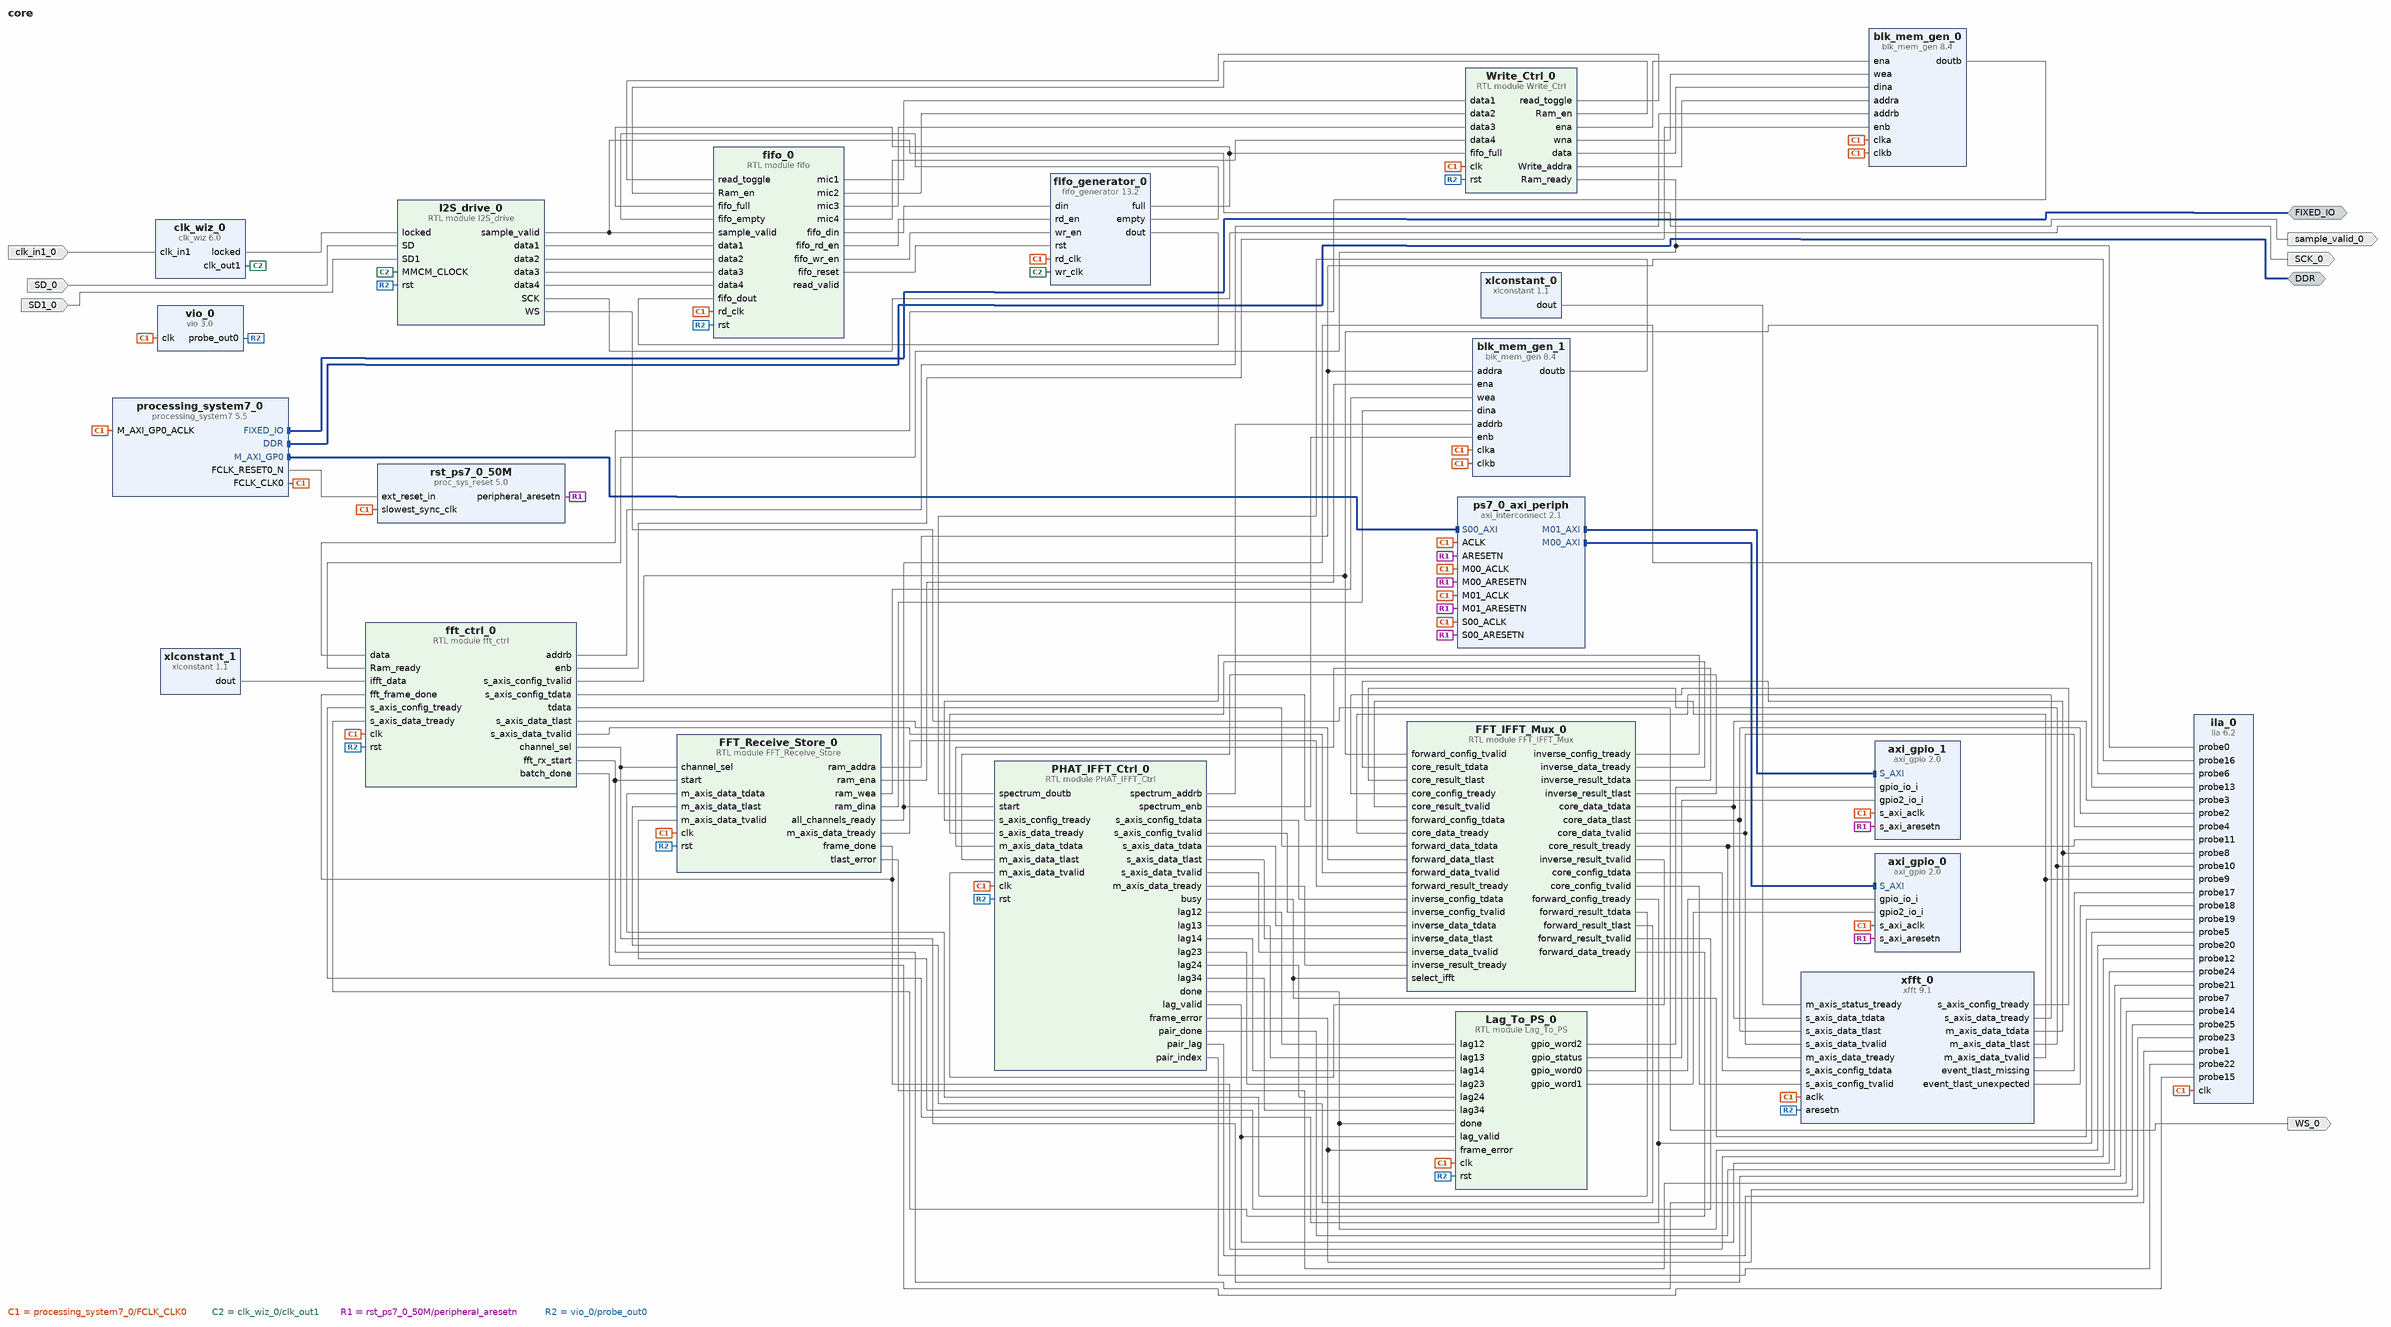
[diagram p0: block diagram of the top level]
# Vivado block design core, xc7z020clg400-1, Vivado 2018.3
create_bd_design core

create_bd_intf_port -mode Master -vlnv xilinx.com:interface:ddrx_rtl:1.0 DDR
create_bd_intf_port -mode Master -vlnv xilinx.com:display_processing_system7:fixedio_rtl:1.0 FIXED_IO
create_bd_port -dir I -type clk clk_in1_0
create_bd_port -dir I SD_0
create_bd_port -dir O SCK_0
create_bd_port -dir O WS_0
create_bd_port -dir O sample_valid_0
create_bd_port -dir I SD1_0

create_bd_cell -type ip -vlnv xilinx.com:ip:processing_system7:5.5 processing_system7_0
set_property -dict [list \
  CONFIG.PCW_GPIO_MIO_GPIO_ENABLE 0 \
  CONFIG.PCW_PRESET_BANK1_VOLTAGE {LVCMOS 1.8V} \
  CONFIG.PCW_QSPI_PERIPHERAL_ENABLE 0 \
  CONFIG.PCW_UART0_PERIPHERAL_ENABLE 1 \
  CONFIG.PCW_UART0_UART0_IO {MIO 14 .. 15} \
  CONFIG.PCW_UART_PERIPHERAL_FREQMHZ 100 \
  CONFIG.PCW_UIPARAM_DDR_FREQ_MHZ 533.333333 \
  CONFIG.PCW_UIPARAM_DDR_PARTNO {MT41K256M16 RE-125} \
] [get_bd_cells processing_system7_0]
# 71 more settings of processing_system7_0 are not shown: defaults, MIO pin electricals, DDR timing, and values the tool derives
create_bd_cell -type ip -vlnv xilinx.com:ip:clk_wiz:6.0 clk_wiz_0
set_property -dict [list \
  CONFIG.CLKOUT1_JITTER 299.507 \
  CONFIG.CLKOUT1_PHASE_ERROR 189.550 \
  CONFIG.CLKOUT1_REQUESTED_OUT_FREQ 11.2896 \
  CONFIG.MMCM_CLKFBOUT_MULT_F 31.625 \
  CONFIG.MMCM_CLKOUT0_DIVIDE_F 93.375 \
  CONFIG.MMCM_DIVCLK_DIVIDE 3 \
] [get_bd_cells clk_wiz_0]
create_bd_cell -type ip -vlnv xilinx.com:ip:axi_gpio:2.0 axi_gpio_0
set_property -dict [list \
  CONFIG.C_ALL_INPUTS 1 \
  CONFIG.C_ALL_INPUTS_2 1 \
  CONFIG.C_GPIO2_WIDTH 32 \
  CONFIG.C_GPIO_WIDTH 32 \
  CONFIG.C_IS_DUAL 1 \
] [get_bd_cells axi_gpio_0]
create_bd_cell -type ip -vlnv xilinx.com:ip:axi_interconnect:2.1 ps7_0_axi_periph
set_property -dict {CONFIG.NUM_MI 2} [get_bd_cells ps7_0_axi_periph]
create_bd_cell -type ip -vlnv xilinx.com:ip:proc_sys_reset:5.0 rst_ps7_0_50M
create_bd_cell -type ip -vlnv xilinx.com:ip:fifo_generator:13.2 fifo_generator_0
set_property -dict [list \
  CONFIG.Enable_Safety_Circuit true \
  CONFIG.Fifo_Implementation Independent_Clocks_Block_RAM \
  CONFIG.Full_Flags_Reset_Value 1 \
  CONFIG.Input_Data_Width 96 \
  CONFIG.Input_Depth 2048 \
  CONFIG.Output_Data_Width 96 \
  CONFIG.Performance_Options First_Word_Fall_Through \
  CONFIG.Use_Extra_Logic false \
] [get_bd_cells fifo_generator_0]
create_bd_cell -type ip -vlnv xilinx.com:ip:axi_gpio:2.0 axi_gpio_1
set_property -dict [list \
  CONFIG.C_ALL_INPUTS 1 \
  CONFIG.C_ALL_INPUTS_2 1 \
  CONFIG.C_GPIO2_WIDTH 32 \
  CONFIG.C_GPIO_WIDTH 32 \
  CONFIG.C_IS_DUAL 1 \
] [get_bd_cells axi_gpio_1]
create_bd_cell -type ip -vlnv xilinx.com:ip:xfft:9.1 xfft_0
set_property -dict [list \
  CONFIG.aresetn true \
  CONFIG.data_format fixed_point \
  CONFIG.implementation_options radix_4_burst_io \
  CONFIG.input_width 24 \
  CONFIG.number_of_stages_using_block_ram_for_data_and_phase_factors 0 \
  CONFIG.output_ordering natural_order \
  CONFIG.phase_factor_width 24 \
  CONFIG.rounding_modes convergent_rounding \
  CONFIG.scaling_options block_floating_point \
  CONFIG.target_clock_frequency 50 \
  CONFIG.transform_length 4096 \
] [get_bd_cells xfft_0]
create_bd_cell -type ip -vlnv xilinx.com:ip:blk_mem_gen:8.4 blk_mem_gen_0
set_property -dict [list \
  CONFIG.Enable_32bit_Address false \
  CONFIG.Enable_B Use_ENB_Pin \
  CONFIG.Memory_Type Simple_Dual_Port_RAM \
  CONFIG.Operating_Mode_A NO_CHANGE \
  CONFIG.Port_A_Write_Rate 50 \
  CONFIG.Port_B_Clock 100 \
  CONFIG.Port_B_Enable_Rate 100 \
  CONFIG.Read_Width_B 24 \
  CONFIG.Register_PortB_Output_of_Memory_Primitives true \
  CONFIG.Use_Byte_Write_Enable false \
  CONFIG.Use_RSTB_Pin false \
  CONFIG.Write_Depth_A 2048 \
  CONFIG.Write_Width_A 96 \
  CONFIG.Write_Width_B 24 \
  CONFIG.use_bram_block Stand_Alone \
] [get_bd_cells blk_mem_gen_0]
create_bd_cell -type module -reference fifo fifo_0
create_bd_cell -type module -reference FFT_Receive_Store FFT_Receive_Store_0
create_bd_cell -type ip -vlnv xilinx.com:ip:blk_mem_gen:8.4 blk_mem_gen_1
set_property -dict [list \
  CONFIG.Enable_32bit_Address false \
  CONFIG.Enable_B Use_ENB_Pin \
  CONFIG.Memory_Type Simple_Dual_Port_RAM \
  CONFIG.Operating_Mode_A NO_CHANGE \
  CONFIG.Port_B_Clock 100 \
  CONFIG.Port_B_Enable_Rate 100 \
  CONFIG.Read_Width_B 48 \
  CONFIG.Register_PortB_Output_of_Memory_Primitives true \
  CONFIG.Use_Byte_Write_Enable false \
  CONFIG.Write_Depth_A 16384 \
  CONFIG.Write_Width_A 48 \
  CONFIG.Write_Width_B 48 \
  CONFIG.use_bram_block Stand_Alone \
] [get_bd_cells blk_mem_gen_1]
create_bd_cell -type module -reference fft_ctrl fft_ctrl_0
create_bd_cell -type ip -vlnv xilinx.com:ip:xlconstant:1.1 xlconstant_0
create_bd_cell -type ip -vlnv xilinx.com:ip:xlconstant:1.1 xlconstant_1
set_property -dict {CONFIG.CONST_VAL 0 CONFIG.CONST_WIDTH 48} [get_bd_cells xlconstant_1]
create_bd_cell -type ip -vlnv xilinx.com:ip:ila:6.2 ila_0
set_property -dict [list \
  CONFIG.C_DATA_DEPTH 4096 \
  CONFIG.C_ENABLE_ILA_AXI_MON false \
  CONFIG.C_MONITOR_TYPE Native \
  CONFIG.C_NUM_OF_PROBES 26 \
  CONFIG.C_PROBE16_WIDTH 14 \
  CONFIG.C_PROBE22_WIDTH 3 \
  CONFIG.C_PROBE23_WIDTH 16 \
  CONFIG.C_PROBE24_WIDTH 6 \
  CONFIG.C_PROBE3_WIDTH 48 \
  CONFIG.C_PROBE7_WIDTH 2 \
  CONFIG.C_PROBE8_WIDTH 48 \
] [get_bd_cells ila_0]
create_bd_cell -type ip -vlnv xilinx.com:ip:vio:3.0 vio_0
set_property -dict {CONFIG.C_NUM_PROBE_IN 0} [get_bd_cells vio_0]
create_bd_cell -type module -reference PHAT_IFFT_Ctrl PHAT_IFFT_Ctrl_0
create_bd_cell -type module -reference FFT_IFFT_Mux FFT_IFFT_Mux_0
create_bd_cell -type module -reference I2S_drive I2S_drive_0
create_bd_cell -type module -reference Write_Ctrl Write_Ctrl_0
create_bd_cell -type module -reference Lag_To_PS Lag_To_PS_0

# ---- connections ----

connect_bd_intf_net [get_bd_intf_pins processing_system7_0/M_AXI_GP0] [get_bd_intf_pins ps7_0_axi_periph/S00_AXI]
connect_bd_intf_net [get_bd_intf_ports FIXED_IO] [get_bd_intf_pins processing_system7_0/FIXED_IO]
connect_bd_intf_net [get_bd_intf_pins ps7_0_axi_periph/M00_AXI] [get_bd_intf_pins axi_gpio_0/S_AXI]
connect_bd_intf_net [get_bd_intf_ports DDR] [get_bd_intf_pins processing_system7_0/DDR]
connect_bd_intf_net [get_bd_intf_pins ps7_0_axi_periph/M01_AXI] [get_bd_intf_pins axi_gpio_1/S_AXI]
connect_bd_net [get_bd_pins processing_system7_0/FCLK_CLK0] \
  [get_bd_pins processing_system7_0/M_AXI_GP0_ACLK] [get_bd_pins ps7_0_axi_periph/S00_ACLK] \
  [get_bd_pins rst_ps7_0_50M/slowest_sync_clk] [get_bd_pins axi_gpio_0/s_axi_aclk] [get_bd_pins ps7_0_axi_periph/M00_ACLK] \
  [get_bd_pins ps7_0_axi_periph/ACLK] [get_bd_pins fifo_generator_0/rd_clk] [get_bd_pins axi_gpio_1/s_axi_aclk] \
  [get_bd_pins ps7_0_axi_periph/M01_ACLK] [get_bd_pins fifo_0/rd_clk] [get_bd_pins FFT_Receive_Store_0/clk] \
  [get_bd_pins blk_mem_gen_1/clka] [get_bd_pins blk_mem_gen_0/clkb] [get_bd_pins fft_ctrl_0/clk] [get_bd_pins xfft_0/aclk] \
  [get_bd_pins blk_mem_gen_0/clka] [get_bd_pins ila_0/clk] [get_bd_pins vio_0/clk] [get_bd_pins PHAT_IFFT_Ctrl_0/clk] \
  [get_bd_pins blk_mem_gen_1/clkb] [get_bd_pins Write_Ctrl_0/clk] [get_bd_pins Lag_To_PS_0/clk]
connect_bd_net [get_bd_pins clk_wiz_0/locked] [get_bd_pins I2S_drive_0/locked]
connect_bd_net [get_bd_pins clk_wiz_0/clk_out1] [get_bd_pins fifo_generator_0/wr_clk] [get_bd_pins I2S_drive_0/MMCM_CLOCK]
connect_bd_net -net clk_in1_0_1 [get_bd_ports clk_in1_0] [get_bd_pins clk_wiz_0/clk_in1]
connect_bd_net -net SD_0_1 [get_bd_ports SD_0] [get_bd_pins I2S_drive_0/SD]
connect_bd_net [get_bd_pins I2S_drive_0/SCK] [get_bd_ports SCK_0]
connect_bd_net [get_bd_pins I2S_drive_0/WS] [get_bd_ports WS_0]
connect_bd_net [get_bd_pins I2S_drive_0/sample_valid] [get_bd_ports sample_valid_0] [get_bd_pins fifo_0/sample_valid]
connect_bd_net [get_bd_pins processing_system7_0/FCLK_RESET0_N] [get_bd_pins rst_ps7_0_50M/ext_reset_in]
connect_bd_net [get_bd_pins rst_ps7_0_50M/peripheral_aresetn] \
  [get_bd_pins ps7_0_axi_periph/S00_ARESETN] [get_bd_pins axi_gpio_0/s_axi_aresetn] \
  [get_bd_pins ps7_0_axi_periph/M00_ARESETN] [get_bd_pins ps7_0_axi_periph/ARESETN] [get_bd_pins axi_gpio_1/s_axi_aresetn] \
  [get_bd_pins ps7_0_axi_periph/M01_ARESETN]
connect_bd_net [get_bd_pins I2S_drive_0/data1] [get_bd_pins fifo_0/data1]
connect_bd_net [get_bd_pins I2S_drive_0/data2] [get_bd_pins fifo_0/data2]
connect_bd_net [get_bd_pins fifo_generator_0/full] [get_bd_pins fifo_0/fifo_full] [get_bd_pins Write_Ctrl_0/fifo_full]
connect_bd_net [get_bd_pins fifo_generator_0/empty] [get_bd_pins fifo_0/fifo_empty]
connect_bd_net [get_bd_pins fifo_0/fifo_din] [get_bd_pins fifo_generator_0/din]
connect_bd_net [get_bd_pins fifo_generator_0/dout] [get_bd_pins fifo_0/fifo_dout]
connect_bd_net [get_bd_pins fifo_0/fifo_rd_en] [get_bd_pins fifo_generator_0/rd_en]
# net fifo_0_read_valid has one end: fifo_0/read_valid
connect_bd_net [get_bd_pins fifo_0/fifo_wr_en] [get_bd_pins fifo_generator_0/wr_en]
connect_bd_net [get_bd_pins fifo_0/fifo_reset] [get_bd_pins fifo_generator_0/rst]
connect_bd_net [get_bd_pins I2S_drive_0/data3] [get_bd_pins fifo_0/data3]
connect_bd_net [get_bd_pins I2S_drive_0/data4] [get_bd_pins fifo_0/data4]
connect_bd_net [get_bd_pins fifo_0/mic1] [get_bd_pins Write_Ctrl_0/data1]
connect_bd_net [get_bd_pins fifo_0/mic2] [get_bd_pins Write_Ctrl_0/data2]
connect_bd_net [get_bd_pins fifo_0/mic3] [get_bd_pins Write_Ctrl_0/data3]
connect_bd_net [get_bd_pins fifo_0/mic4] [get_bd_pins Write_Ctrl_0/data4]
connect_bd_net [get_bd_pins Write_Ctrl_0/ena] [get_bd_pins blk_mem_gen_0/ena]
connect_bd_net [get_bd_pins Write_Ctrl_0/wna] [get_bd_pins blk_mem_gen_0/wea]
connect_bd_net [get_bd_pins Write_Ctrl_0/read_toggle] [get_bd_pins fifo_0/read_toggle]
connect_bd_net [get_bd_pins Write_Ctrl_0/Ram_en] [get_bd_pins fifo_0/Ram_en]
connect_bd_net [get_bd_pins Write_Ctrl_0/data] [get_bd_pins blk_mem_gen_0/dina]
connect_bd_net [get_bd_pins Write_Ctrl_0/Write_addra] [get_bd_pins blk_mem_gen_0/addra]
connect_bd_net [get_bd_pins fft_ctrl_0/addrb] [get_bd_pins blk_mem_gen_0/addrb]
connect_bd_net [get_bd_pins blk_mem_gen_0/doutb] [get_bd_pins fft_ctrl_0/data]
connect_bd_net [get_bd_pins fft_ctrl_0/enb] [get_bd_pins blk_mem_gen_0/enb]
connect_bd_net [get_bd_pins Write_Ctrl_0/Ram_ready] [get_bd_pins fft_ctrl_0/Ram_ready] [get_bd_pins ila_0/probe0]
connect_bd_net [get_bd_pins fft_ctrl_0/channel_sel] [get_bd_pins FFT_Receive_Store_0/channel_sel] [get_bd_pins ila_0/probe7]
connect_bd_net [get_bd_pins FFT_Receive_Store_0/frame_done] [get_bd_pins fft_ctrl_0/fft_frame_done] [get_bd_pins ila_0/probe12]
connect_bd_net [get_bd_pins FFT_Receive_Store_0/ram_ena] [get_bd_pins blk_mem_gen_1/ena]
connect_bd_net [get_bd_pins FFT_Receive_Store_0/ram_wea] [get_bd_pins blk_mem_gen_1/wea]
connect_bd_net [get_bd_pins FFT_Receive_Store_0/ram_addra] [get_bd_pins blk_mem_gen_1/addra] [get_bd_pins ila_0/probe16]
connect_bd_net [get_bd_pins FFT_Receive_Store_0/ram_dina] [get_bd_pins blk_mem_gen_1/dina]
connect_bd_net [get_bd_pins xlconstant_0/dout] [get_bd_pins xfft_0/m_axis_status_tready]
connect_bd_net [get_bd_pins xlconstant_1/dout] [get_bd_pins fft_ctrl_0/ifft_data]
connect_bd_net [get_bd_pins FFT_Receive_Store_0/all_channels_ready] [get_bd_pins ila_0/probe13] [get_bd_pins PHAT_IFFT_Ctrl_0/start]
connect_bd_net [get_bd_pins FFT_Receive_Store_0/tlast_error] [get_bd_pins ila_0/probe14]
connect_bd_net [get_bd_pins fft_ctrl_0/batch_done] [get_bd_pins ila_0/probe15]
connect_bd_net [get_bd_pins xfft_0/event_tlast_missing] [get_bd_pins ila_0/probe17]
connect_bd_net [get_bd_pins xfft_0/event_tlast_unexpected] [get_bd_pins ila_0/probe18]
connect_bd_net [get_bd_pins vio_0/probe_out0] \
  [get_bd_pins fft_ctrl_0/rst] [get_bd_pins fifo_0/rst] [get_bd_pins xfft_0/aresetn] [get_bd_pins FFT_Receive_Store_0/rst] \
  [get_bd_pins PHAT_IFFT_Ctrl_0/rst] [get_bd_pins I2S_drive_0/rst] [get_bd_pins Write_Ctrl_0/rst] \
  [get_bd_pins Lag_To_PS_0/rst]
connect_bd_net [get_bd_pins fft_ctrl_0/fft_rx_start] [get_bd_pins FFT_Receive_Store_0/start] [get_bd_pins ila_0/probe1]
connect_bd_net [get_bd_pins blk_mem_gen_1/doutb] [get_bd_pins PHAT_IFFT_Ctrl_0/spectrum_doutb]
connect_bd_net [get_bd_pins PHAT_IFFT_Ctrl_0/spectrum_addrb] [get_bd_pins blk_mem_gen_1/addrb]
connect_bd_net [get_bd_pins fft_ctrl_0/s_axis_config_tdata] [get_bd_pins FFT_IFFT_Mux_0/forward_config_tdata]
connect_bd_net [get_bd_pins fft_ctrl_0/s_axis_config_tvalid] [get_bd_pins FFT_IFFT_Mux_0/forward_config_tvalid] [get_bd_pins ila_0/probe6]
connect_bd_net [get_bd_pins FFT_IFFT_Mux_0/forward_config_tready] [get_bd_pins fft_ctrl_0/s_axis_config_tready] [get_bd_pins ila_0/probe5]
connect_bd_net [get_bd_pins fft_ctrl_0/tdata] [get_bd_pins FFT_IFFT_Mux_0/forward_data_tdata]
connect_bd_net [get_bd_pins fft_ctrl_0/s_axis_data_tlast] [get_bd_pins FFT_IFFT_Mux_0/forward_data_tlast]
connect_bd_net [get_bd_pins fft_ctrl_0/s_axis_data_tvalid] [get_bd_pins FFT_IFFT_Mux_0/forward_data_tvalid]
connect_bd_net [get_bd_pins FFT_IFFT_Mux_0/forward_data_tready] [get_bd_pins fft_ctrl_0/s_axis_data_tready]
connect_bd_net [get_bd_pins FFT_IFFT_Mux_0/forward_result_tdata] [get_bd_pins FFT_Receive_Store_0/m_axis_data_tdata]
connect_bd_net [get_bd_pins FFT_IFFT_Mux_0/forward_result_tlast] [get_bd_pins FFT_Receive_Store_0/m_axis_data_tlast]
connect_bd_net [get_bd_pins FFT_IFFT_Mux_0/forward_result_tvalid] [get_bd_pins FFT_Receive_Store_0/m_axis_data_tvalid]
connect_bd_net [get_bd_pins FFT_Receive_Store_0/m_axis_data_tready] [get_bd_pins FFT_IFFT_Mux_0/forward_result_tready]
connect_bd_net [get_bd_pins PHAT_IFFT_Ctrl_0/s_axis_config_tdata] [get_bd_pins FFT_IFFT_Mux_0/inverse_config_tdata]
connect_bd_net [get_bd_pins PHAT_IFFT_Ctrl_0/s_axis_config_tvalid] [get_bd_pins FFT_IFFT_Mux_0/inverse_config_tvalid]
connect_bd_net [get_bd_pins FFT_IFFT_Mux_0/inverse_config_tready] [get_bd_pins PHAT_IFFT_Ctrl_0/s_axis_config_tready]
connect_bd_net [get_bd_pins PHAT_IFFT_Ctrl_0/s_axis_data_tdata] [get_bd_pins FFT_IFFT_Mux_0/inverse_data_tdata]
connect_bd_net [get_bd_pins PHAT_IFFT_Ctrl_0/s_axis_data_tlast] [get_bd_pins FFT_IFFT_Mux_0/inverse_data_tlast]
connect_bd_net [get_bd_pins PHAT_IFFT_Ctrl_0/s_axis_data_tvalid] [get_bd_pins FFT_IFFT_Mux_0/inverse_data_tvalid]
connect_bd_net [get_bd_pins FFT_IFFT_Mux_0/inverse_data_tready] [get_bd_pins PHAT_IFFT_Ctrl_0/s_axis_data_tready]
connect_bd_net [get_bd_pins FFT_IFFT_Mux_0/inverse_result_tdata] [get_bd_pins PHAT_IFFT_Ctrl_0/m_axis_data_tdata]
connect_bd_net [get_bd_pins FFT_IFFT_Mux_0/inverse_result_tlast] [get_bd_pins PHAT_IFFT_Ctrl_0/m_axis_data_tlast]
connect_bd_net [get_bd_pins FFT_IFFT_Mux_0/inverse_result_tvalid] [get_bd_pins PHAT_IFFT_Ctrl_0/m_axis_data_tvalid]
connect_bd_net [get_bd_pins PHAT_IFFT_Ctrl_0/m_axis_data_tready] [get_bd_pins FFT_IFFT_Mux_0/inverse_result_tready]
connect_bd_net [get_bd_pins FFT_IFFT_Mux_0/core_config_tdata] [get_bd_pins xfft_0/s_axis_config_tdata]
connect_bd_net [get_bd_pins xfft_0/s_axis_config_tready] [get_bd_pins FFT_IFFT_Mux_0/core_config_tready]
connect_bd_net [get_bd_pins FFT_IFFT_Mux_0/core_config_tvalid] [get_bd_pins xfft_0/s_axis_config_tvalid]
connect_bd_net [get_bd_pins FFT_IFFT_Mux_0/core_data_tdata] [get_bd_pins xfft_0/s_axis_data_tdata] [get_bd_pins ila_0/probe3]
connect_bd_net [get_bd_pins FFT_IFFT_Mux_0/core_data_tlast] [get_bd_pins xfft_0/s_axis_data_tlast] [get_bd_pins ila_0/probe2]
connect_bd_net [get_bd_pins FFT_IFFT_Mux_0/core_data_tvalid] [get_bd_pins xfft_0/s_axis_data_tvalid] [get_bd_pins ila_0/probe4]
connect_bd_net [get_bd_pins xfft_0/s_axis_data_tready] [get_bd_pins FFT_IFFT_Mux_0/core_data_tready]
connect_bd_net [get_bd_pins xfft_0/m_axis_data_tdata] [get_bd_pins FFT_IFFT_Mux_0/core_result_tdata] [get_bd_pins ila_0/probe8]
connect_bd_net [get_bd_pins xfft_0/m_axis_data_tlast] [get_bd_pins FFT_IFFT_Mux_0/core_result_tlast] [get_bd_pins ila_0/probe10]
connect_bd_net [get_bd_pins xfft_0/m_axis_data_tvalid] [get_bd_pins FFT_IFFT_Mux_0/core_result_tvalid] [get_bd_pins ila_0/probe9]
connect_bd_net [get_bd_pins FFT_IFFT_Mux_0/core_result_tready] [get_bd_pins xfft_0/m_axis_data_tready] [get_bd_pins ila_0/probe11]
connect_bd_net [get_bd_pins PHAT_IFFT_Ctrl_0/busy] [get_bd_pins ila_0/probe19] [get_bd_pins FFT_IFFT_Mux_0/select_ifft]
connect_bd_net [get_bd_pins PHAT_IFFT_Ctrl_0/done] [get_bd_pins ila_0/probe20] [get_bd_pins Lag_To_PS_0/done]
connect_bd_net [get_bd_pins PHAT_IFFT_Ctrl_0/pair_done] [get_bd_pins ila_0/probe21]
connect_bd_net [get_bd_pins PHAT_IFFT_Ctrl_0/pair_lag] [get_bd_pins ila_0/probe23]
connect_bd_net [get_bd_pins PHAT_IFFT_Ctrl_0/lag_valid] [get_bd_pins ila_0/probe24] [get_bd_pins Lag_To_PS_0/lag_valid]
connect_bd_net [get_bd_pins PHAT_IFFT_Ctrl_0/frame_error] [get_bd_pins ila_0/probe25] [get_bd_pins Lag_To_PS_0/frame_error]
connect_bd_net [get_bd_pins PHAT_IFFT_Ctrl_0/pair_index] [get_bd_pins ila_0/probe22]
connect_bd_net [get_bd_pins PHAT_IFFT_Ctrl_0/spectrum_enb] [get_bd_pins blk_mem_gen_1/enb]
connect_bd_net -net SD1_0_1 [get_bd_ports SD1_0] [get_bd_pins I2S_drive_0/SD1]
connect_bd_net [get_bd_pins PHAT_IFFT_Ctrl_0/lag12] [get_bd_pins Lag_To_PS_0/lag12]
connect_bd_net [get_bd_pins PHAT_IFFT_Ctrl_0/lag13] [get_bd_pins Lag_To_PS_0/lag13]
connect_bd_net [get_bd_pins PHAT_IFFT_Ctrl_0/lag14] [get_bd_pins Lag_To_PS_0/lag14]
connect_bd_net [get_bd_pins PHAT_IFFT_Ctrl_0/lag23] [get_bd_pins Lag_To_PS_0/lag23]
connect_bd_net [get_bd_pins PHAT_IFFT_Ctrl_0/lag24] [get_bd_pins Lag_To_PS_0/lag24]
connect_bd_net [get_bd_pins PHAT_IFFT_Ctrl_0/lag34] [get_bd_pins Lag_To_PS_0/lag34]
connect_bd_net [get_bd_pins Lag_To_PS_0/gpio_word0] [get_bd_pins axi_gpio_0/gpio_io_i]
connect_bd_net [get_bd_pins Lag_To_PS_0/gpio_word1] [get_bd_pins axi_gpio_0/gpio2_io_i]
connect_bd_net [get_bd_pins Lag_To_PS_0/gpio_word2] [get_bd_pins axi_gpio_1/gpio_io_i]
connect_bd_net [get_bd_pins Lag_To_PS_0/gpio_status] [get_bd_pins axi_gpio_1/gpio2_io_i]

# ---- address map ----
assign_bd_address -offset 0x41200000 -range 64K -target_address_space [get_bd_addr_spaces processing_system7_0/Data] [get_bd_addr_segs axi_gpio_0/S_AXI/Reg]
assign_bd_address -offset 0x41210000 -range 64K -target_address_space [get_bd_addr_spaces processing_system7_0/Data] [get_bd_addr_segs axi_gpio_1/S_AXI/Reg]

validate_bd_design
save_bd_design
